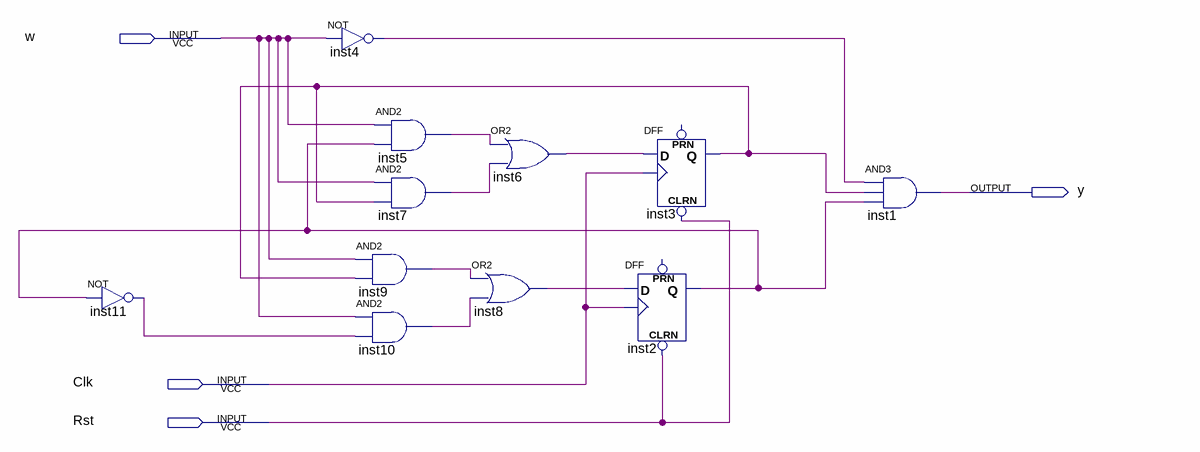
[diagram p0: schematic sheet]
// Quartus schematic MealyFSMDiagram.bdf as structural Verilog: 11 symbols, 4 pins
module MealyFSMDiagram (
  input  w,
  input  Clk,
  input  Rst,
  output y
);

  wire inst2_q, inst3_q, inst4_out, inst5_out, inst6_out, inst7_out, inst8_out, inst9_out, inst10_out,
       inst11_out;

  not inst11 (inst11_out, inst2_q);
  not inst4 (inst4_out, w);
  and inst5 (inst5_out, w, inst2_q);
  and inst7 (inst7_out, w, inst3_q);
  and inst9 (inst9_out, w, inst3_q);
  and inst10 (inst10_out, w, inst11_out);
  or inst8 (inst8_out, inst9_out, inst10_out);
  or inst6 (inst6_out, inst5_out, inst7_out);
  DFF inst2 (.CLRN(Rst), .CLK(Clk), .D(inst8_out), .Q(inst2_q));  // open: PRN
  DFF inst3 (.CLRN(Rst), .CLK(Clk), .D(inst6_out), .Q(inst3_q));  // open: PRN
  and inst1 (y, inst4_out, inst3_q, inst2_q);
endmodule
